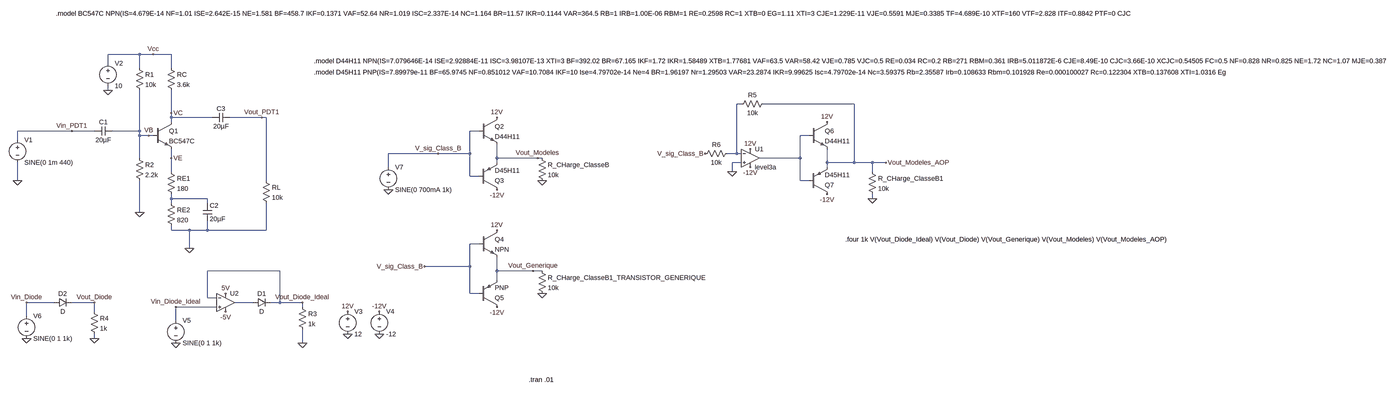
[diagram p0: schematic TP1.asc, whole sheet]
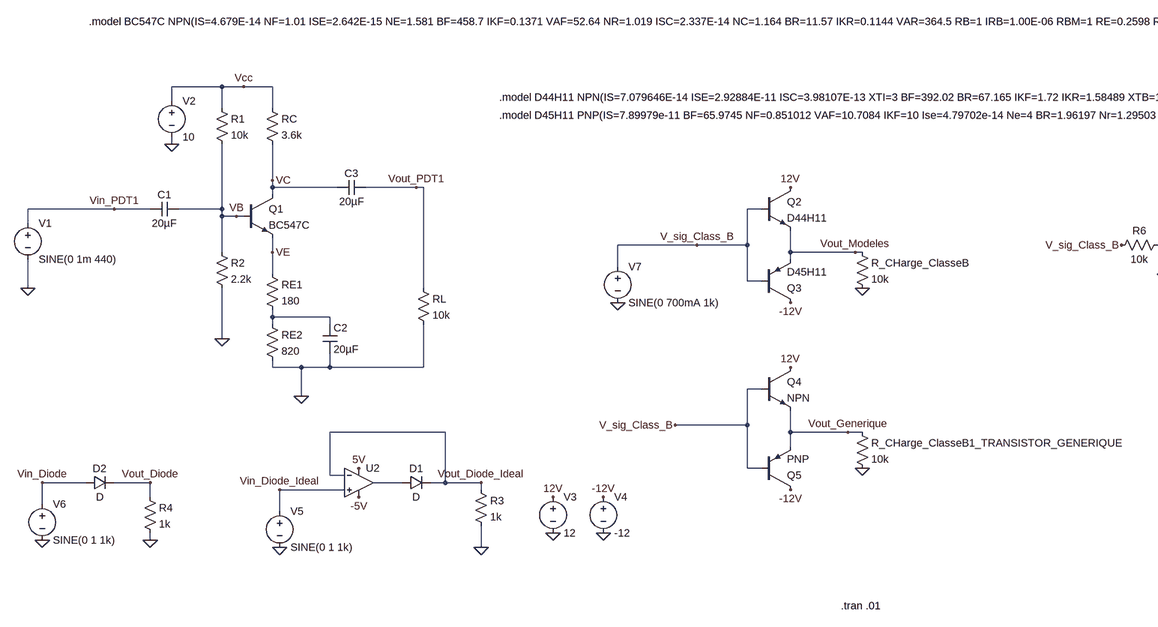
[diagram p1: schematic TP1.asc, part, row 1 of 1, column 1 of 2]
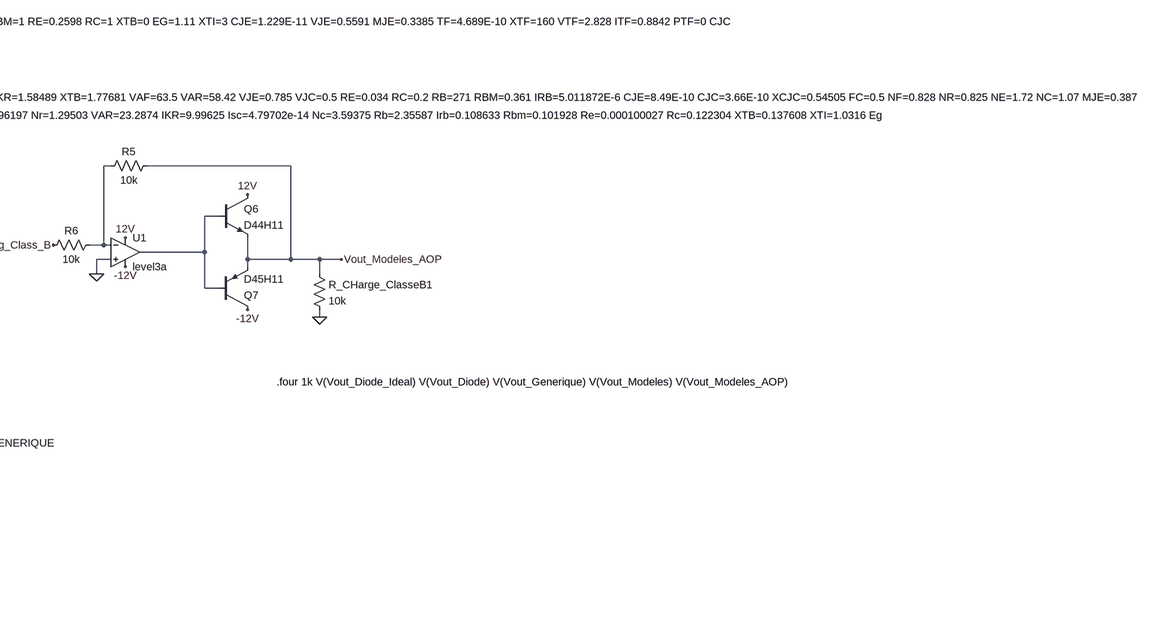
[diagram p2: schematic TP1.asc, part, row 1 of 1, column 2 of 2]
TP1.asc, the LTspice schematic file:
Version 4
SHEET 1 7796 1108
WIRE 208 -240 96 -240
WIRE 256 -240 208 -240
WIRE 320 -240 256 -240
WIRE 96 -208 96 -240
WIRE 208 -192 208 -240
WIRE 320 -192 320 -240
WIRE 96 -112 96 -128
WIRE 2336 -64 2320 -64
WIRE 2736 -64 2416 -64
WIRE 320 -32 320 -112
WIRE 320 -16 320 -32
WIRE 464 -16 320 -16
WIRE 640 -16 528 -16
WIRE 656 -16 640 -16
WIRE 320 0 320 -16
WIRE -32 32 -224 32
WIRE 48 32 -32 32
WIRE 208 32 208 -112
WIRE 208 32 112 32
WIRE 1408 32 1376 32
WIRE 208 48 208 32
WIRE 240 48 208 48
WIRE 256 48 240 48
WIRE 2576 48 2544 48
WIRE -224 64 -224 32
WIRE 1264 112 1088 112
WIRE 1376 112 1376 32
WIRE 1376 112 1264 112
WIRE 2320 112 2320 -64
WIRE 2320 112 2288 112
WIRE 2336 112 2320 112
WIRE 208 128 208 48
WIRE 320 128 320 96
WIRE 1472 128 1472 80
WIRE 1616 128 1472 128
WIRE 1632 128 1616 128
WIRE 2544 128 2544 48
WIRE 2544 128 2400 128
WIRE 1472 144 1472 128
WIRE 2336 144 2304 144
WIRE 2640 144 2640 96
WIRE 2736 144 2736 -64
WIRE 2736 144 2640 144
WIRE 2800 144 2736 144
WIRE 2848 144 2800 144
WIRE 1088 160 1088 112
WIRE 2640 160 2640 144
WIRE 320 176 320 128
WIRE 2304 176 2304 144
WIRE 2800 176 2800 144
WIRE 1376 192 1376 112
WIRE 1408 192 1376 192
WIRE -224 208 -224 144
WIRE 656 208 656 -16
WIRE 2544 208 2544 128
WIRE 2576 208 2544 208
WIRE 320 272 320 256
WIRE 448 272 320 272
WIRE 2800 272 2800 256
WIRE 320 288 320 272
WIRE 448 288 448 272
WIRE 208 320 208 208
WIRE 320 384 320 368
WIRE 384 384 320 384
WIRE 448 384 448 352
WIRE 448 384 384 384
WIRE 656 384 656 288
WIRE 656 384 448 384
WIRE 1408 432 1376 432
WIRE 384 448 384 384
WIRE 1376 512 1376 432
WIRE 1376 512 1216 512
WIRE 704 528 448 528
WIRE 1472 528 1472 480
WIRE 1600 528 1472 528
WIRE 1632 528 1600 528
WIRE 1472 560 1472 528
WIRE 1376 608 1376 512
WIRE 1408 608 1376 608
WIRE 448 624 448 528
WIRE 480 624 448 624
WIRE -96 640 -192 640
WIRE 48 640 -32 640
WIRE 608 640 544 640
WIRE 704 640 704 528
WIRE 704 640 672 640
WIRE 784 640 704 640
WIRE 480 656 336 656
WIRE 784 656 784 640
WIRE 48 672 48 640
WIRE -192 688 -192 640
WIRE 336 704 336 656
WIRE 48 768 48 752
WIRE 784 784 784 736
FLAG 96 -112 0
FLAG -224 208 0
FLAG 208 320 0
FLAG 384 448 0
FLAG 944 752 0
FLAG 1056 752 0
FLAG 944 672 12V
FLAG 1056 672 -12V
FLAG 784 784 0
FLAG 336 784 0
FLAG 512 608 5V
FLAG 512 672 -5V
FLAG 640 -16 Vout_PDT1
FLAG -32 32 Vin_PDT1
FLAG 320 128 VE
FLAG 320 -32 VC
FLAG 240 48 VB
FLAG 256 -240 Vcc
FLAG -192 768 0
FLAG 48 768 0
FLAG 48 640 Vout_Diode
FLAG -192 640 Vin_Diode
FLAG 336 656 Vin_Diode_Ideal
FLAG 784 640 Vout_Diode_Ideal
FLAG 1472 -16 12V
FLAG 1472 240 -12V
FLAG 1088 240 0
FLAG 1632 208 0
FLAG 1472 384 12V
FLAG 1472 656 -12V
FLAG 1632 608 0
FLAG 1600 528 Vout_Generique
FLAG 1616 128 Vout_Modeles
FLAG 1264 112 V_sig_Class_B
FLAG 1216 512 V_sig_Class_B
FLAG 2640 0 12V
FLAG 2640 256 -12V
FLAG 2800 272 0
FLAG 2848 144 Vout_Modeles_AOP
FLAG 2208 112 V_sig_Class_B
FLAG 2304 176 0
FLAG 2368 160 -12V
FLAG 2368 96 12V
SYMBOL voltage -224 48 R0
WINDOW 123 0 0 Left 0
WINDOW 39 0 0 Left 0
SYMATTR InstName V1
SYMATTR Value SINE(0 1m 440)
SYMBOL res 304 272 R0
SYMATTR InstName RE2
SYMATTR Value 820
SYMBOL res 304 160 R0
SYMATTR InstName RE1
SYMATTR Value 180
SYMBOL cap 112 16 R90
WINDOW 0 0 32 VBottom 2
WINDOW 3 32 32 VTop 2
SYMATTR InstName C1
SYMATTR Value 20µF
SYMBOL cap 528 -32 R90
WINDOW 0 0 32 VBottom 2
WINDOW 3 32 32 VTop 2
SYMATTR InstName C3
SYMATTR Value 20µF
SYMBOL res 640 192 R0
SYMATTR InstName RL
SYMATTR Value 10k
SYMBOL res 304 -208 R0
SYMATTR InstName RC
SYMATTR Value 3.6k
SYMBOL res 192 -208 R0
SYMATTR InstName R1
SYMATTR Value 10k
SYMBOL voltage 96 -224 R0
WINDOW 123 0 0 Left 0
WINDOW 39 0 0 Left 0
SYMATTR InstName V2
SYMATTR Value 10
SYMBOL res 192 112 R0
SYMATTR InstName R2
SYMATTR Value 2.2k
SYMBOL cap 432 288 R0
SYMATTR InstName C2
SYMATTR Value 20µF
SYMBOL npn 256 0 R0
SYMATTR InstName Q1
SYMATTR Value BC547C
SYMBOL diode 608 656 R270
WINDOW 0 32 32 VTop 2
WINDOW 3 0 32 VBottom 2
SYMATTR InstName D1
SYMBOL voltage 944 656 R0
WINDOW 123 0 0 Left 0
WINDOW 39 0 0 Left 0
SYMATTR InstName V3
SYMATTR Value 12
SYMBOL voltage 1056 656 R0
WINDOW 123 0 0 Left 0
WINDOW 39 0 0 Left 0
SYMATTR InstName V4
SYMATTR Value -12
SYMBOL voltage 336 688 R0
WINDOW 123 0 0 Left 0
WINDOW 39 0 0 Left 0
SYMATTR InstName V5
SYMATTR Value SINE(0 1 1k)
SYMBOL OpAmps\\UniversalOpAmp2 512 640 R0
SYMATTR InstName U2
SYMBOL res 768 640 R0
SYMATTR InstName R3
SYMATTR Value 1k
SYMBOL voltage -192 672 R0
WINDOW 123 0 0 Left 0
WINDOW 39 0 0 Left 0
SYMATTR InstName V6
SYMATTR Value SINE(0 1 1k)
SYMBOL diode -96 656 R270
WINDOW 0 32 32 VTop 2
WINDOW 3 0 32 VBottom 2
SYMATTR InstName D2
SYMBOL res 32 656 R0
SYMATTR InstName R4
SYMATTR Value 1k
SYMBOL npn 1408 -16 R0
SYMATTR InstName Q2
SYMATTR Value D44H11
SYMBOL pnp 1408 240 M180
SYMATTR InstName Q3
SYMATTR Value D45H11
SYMBOL voltage 1088 144 R0
WINDOW 123 0 0 Left 0
WINDOW 39 0 0 Left 0
SYMATTR InstName V7
SYMATTR Value SINE(0 700mA 1k)
SYMBOL res 1616 112 R0
SYMATTR InstName R_CHarge_ClasseB
SYMATTR Value 10k
SYMBOL npn 1408 384 R0
SYMATTR InstName Q4
SYMBOL pnp 1408 656 M180
SYMATTR InstName Q5
SYMBOL res 1616 512 R0
SYMATTR InstName R_CHarge_ClasseB1_TRANSISTOR_GENERIQUE
SYMATTR Value 10k
SYMBOL npn 2576 0 R0
SYMATTR InstName Q6
SYMATTR Value D44H11
SYMBOL pnp 2576 256 M180
SYMATTR InstName Q7
SYMATTR Value D45H11
SYMBOL res 2784 160 R0
SYMATTR InstName R_CHarge_ClasseB1
SYMATTR Value 10k
SYMBOL OpAmps\\UniversalOpAmp3 2368 128 R0
SYMATTR InstName U1
SYMBOL res 2432 -80 R90
WINDOW 0 0 56 VBottom 2
WINDOW 3 32 56 VTop 2
SYMATTR InstName R5
SYMATTR Value 10k
SYMBOL res 2304 96 R90
WINDOW 0 0 56 VBottom 2
WINDOW 3 32 56 VTop 2
SYMATTR InstName R6
SYMATTR Value 10k
TEXT -88 -440 Left 2 !.model BC547C NPN(IS=4.679E-14 NF=1.01 ISE=2.642E-15 NE=1.581 BF=458.7 IKF=0.1371 VAF=52.64 NR=1.019 ISC=2.337E-14 NC=1.164 BR=11.57 IKR=0.1144 VAR=364.5 RB=1 IRB=1.00E-06 RBM=1 RE=0.2598 RC=1 XTB=0 EG=1.11 XTI=3 CJE=1.229E-11 VJE=0.5591 MJE=0.3385 TF=4.689E-10 XTF=160 VTF=2.828 ITF=0.8842 PTF=0 CJC=4.42E-12 VJC=0.1994 MJC=0.2782 XCJC=0.6193 TR=1.00E-32 CJS=0 VJS=0.75 MJS=0.333 FC=0.7936 Vceo=45 Icrating=100m mfg=Philips)
TEXT 1584 920 Left 2 !.tran .01
TEXT 824 -176 Left 2 !.model D45H11 PNP(IS=7.89979e-11 BF=65.9745 NF=0.851012 VAF=10.7084 IKF=10 Ise=4.79702e-14 Ne=4 BR=1.96197 Nr=1.29503 VAR=23.2874 IKR=9.99625 Isc=4.79702e-14 Nc=3.59375 Rb=2.35587 Irb=0.108633 Rbm=0.101928 Re=0.000100027 Rc=0.122304 XTB=0.137608 XTI=1.0316 Eg
TEXT 824 -216 Left 2 !.model D44H11 NPN(IS=7.079646E-14 ISE=2.92884E-11 ISC=3.98107E-13 XTI=3 BF=392.02 BR=67.165 IKF=1.72 IKR=1.58489 XTB=1.77681 VAF=63.5 VAR=58.42 VJE=0.785 VJC=0.5 RE=0.034 RC=0.2 RB=271 RBM=0.361 IRB=5.011872E-6 CJE=8.49E-10 CJC=3.66E-10 XCJC=0.54505 FC=0.5 NF=0.828 NR=0.825 NE=1.72 NC=1.07 MJE=0.387 MJC=0.352 EG=0.958 VCEO=80 ICRATING=10 MFG=FAIRCHILD)
TEXT 2704 416 Left 2 !.four 1k V(Vout_Diode_Ideal) V(Vout_Diode) V(Vout_Generique) V(Vout_Modeles) V(Vout_Modeles_AOP)

The netlist it stands for:
* TP1.asc
V1 Vin_PDT1 0 SINE(0 1m 440)
RE2 N003 0 820
RE1 VE N003 180
C1 VB Vin_PDT1 20µF
C3 Vout_PDT1 VC 20µF
RL Vout_PDT1 0 10k
RC Vcc VC 3.6k
R1 Vcc VB 10k
V2 Vcc 0 10
R2 VB 0 2.2k
C2 N003 0 20µF
Q1 VC VB VE 0 BC547C
D1 N004 Vout_Diode_Ideal D
V3 12V 0 12
V4 -12V 0 -12
V5 Vin_Diode_Ideal 0 SINE(0 1 1k)
XU2 Vin_Diode_Ideal Vout_Diode_Ideal 5V -5V N004 level2 Avol=1Meg GBW=10Meg Slew=10Meg Ilimit=25m Rail=0 Vos=0 En=0 Enk=0 In=0 Ink=0 Rin=500Meg  ; pins In+ In- V+ V- OUT
R3 Vout_Diode_Ideal 0 1k
V6 Vin_Diode 0 SINE(0 1 1k)
D2 Vin_Diode Vout_Diode D
R4 Vout_Diode 0 1k
Q2 12V V_sig_Class_B Vout_Modeles 0 D44H11
Q3 -12V V_sig_Class_B Vout_Modeles 0 D45H11
V7 V_sig_Class_B 0 SINE(0 700mA 1k)
R_CHarge_ClasseB Vout_Modeles 0 10k
Q4 12V V_sig_Class_B Vout_Generique 0 NPN
Q5 -12V V_sig_Class_B Vout_Generique 0 PNP
R_CHarge_ClasseB1_TRANSISTOR_GENERIQUE Vout_Generique 0 10k
Q6 12V N002 Vout_Modeles_AOP 0 D44H11
Q7 -12V N002 Vout_Modeles_AOP 0 D45H11
R_CHarge_ClasseB1 Vout_Modeles_AOP 0 10k
XU1 0 N001 12V -12V N002 level3a  ; pins In+ In- V+ V- OUT
R5 Vout_Modeles_AOP N001 10k
R6 N001 V_sig_Class_B 10k
.model D D
.lib standard.dio
.model NPN NPN
.model PNP PNP
.lib standard.bjt
.model BC547C NPN(IS=4.679E-14 NF=1.01 ISE=2.642E-15 NE=1.581 BF=458.7 IKF=0.1371 VAF=52.64 NR=1.019 ISC=2.337E-14 NC=1.164 BR=11.57 IKR=0.1144 VAR=364.5 RB=1 IRB=1.00E-06 RBM=1 RE=0.2598 RC=1 XTB=0 EG=1.11 XTI=3 CJE=1.229E-11 VJE=0.5591 MJE=0.3385 TF=4.689E-10 XTF=160 VTF=2.828 ITF=0.8842 PTF=0 CJC=4.42E-12 VJC=0.1994 MJC=0.2782 XCJC=0.6193 TR=1.00E-32 CJS=0 VJS=0.75 MJS=0.333 FC=0.7936 Vceo=45 Icrating=100m mfg=Philips)
.tran .01
.model D45H11 PNP(IS=7.89979e-11 BF=65.9745 NF=0.851012 VAF=10.7084 IKF=10 Ise=4.79702e-14 Ne=4 BR=1.96197 Nr=1.29503 VAR=23.2874 IKR=9.99625 Isc=4.79702e-14 Nc=3.59375 Rb=2.35587 Irb=0.108633 Rbm=0.101928 Re=0.000100027 Rc=0.122304 XTB=0.137608 XTI=1.0316 Eg
.model D44H11 NPN(IS=7.079646E-14 ISE=2.92884E-11 ISC=3.98107E-13 XTI=3 BF=392.02 BR=67.165 IKF=1.72 IKR=1.58489 XTB=1.77681 VAF=63.5 VAR=58.42 VJE=0.785 VJC=0.5 RE=0.034 RC=0.2 RB=271 RBM=0.361 IRB=5.011872E-6 CJE=8.49E-10 CJC=3.66E-10 XCJC=0.54505 FC=0.5 NF=0.828 NR=0.825 NE=1.72 NC=1.07 MJE=0.387 MJC=0.352 EG=0.958 VCEO=80 ICRATING=10 MFG=FAIRCHILD)
.four 1k V(Vout_Diode_Ideal) V(Vout_Diode) V(Vout_Generique) V(Vout_Modeles) V(Vout_Modeles_AOP)
.lib UniversalOpAmp2.lib
.backanno
.end